# Altium project pyBehaviourLab_breakout(nucleo).PrjPcb
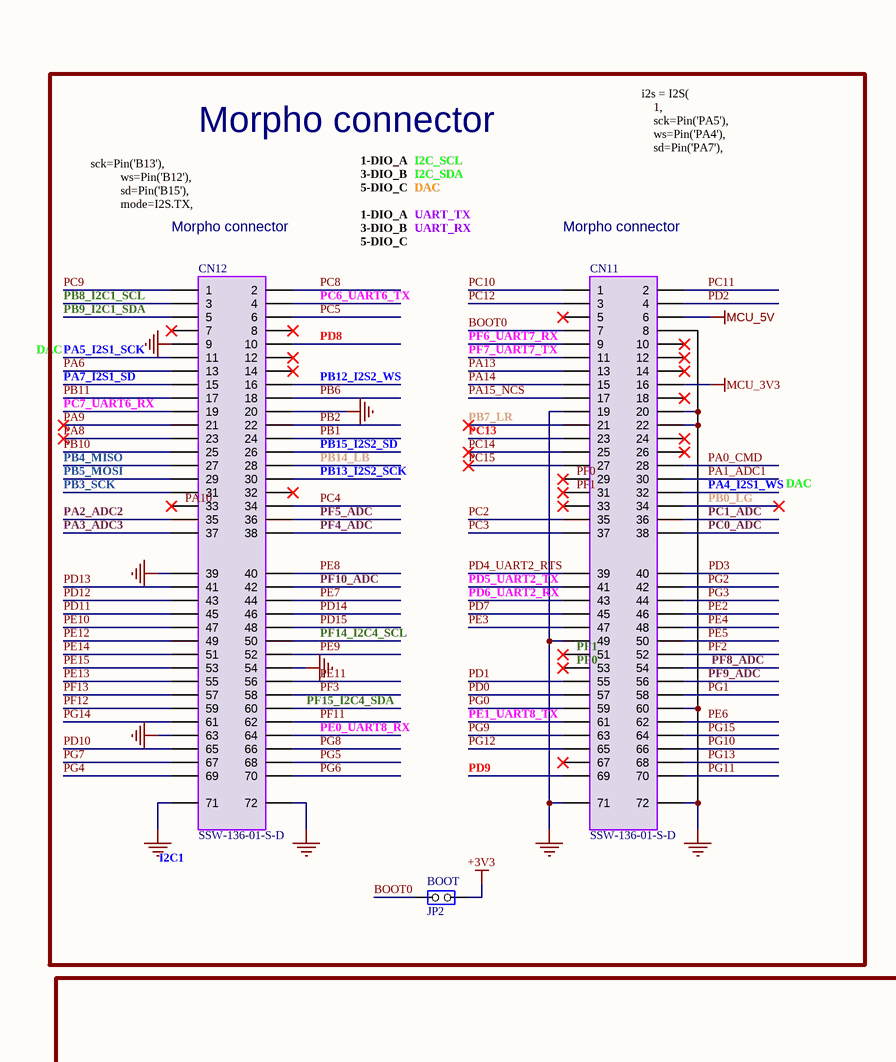
[diagram p0: pyBehaviorLab_breakout_board.SchDoc, top left]
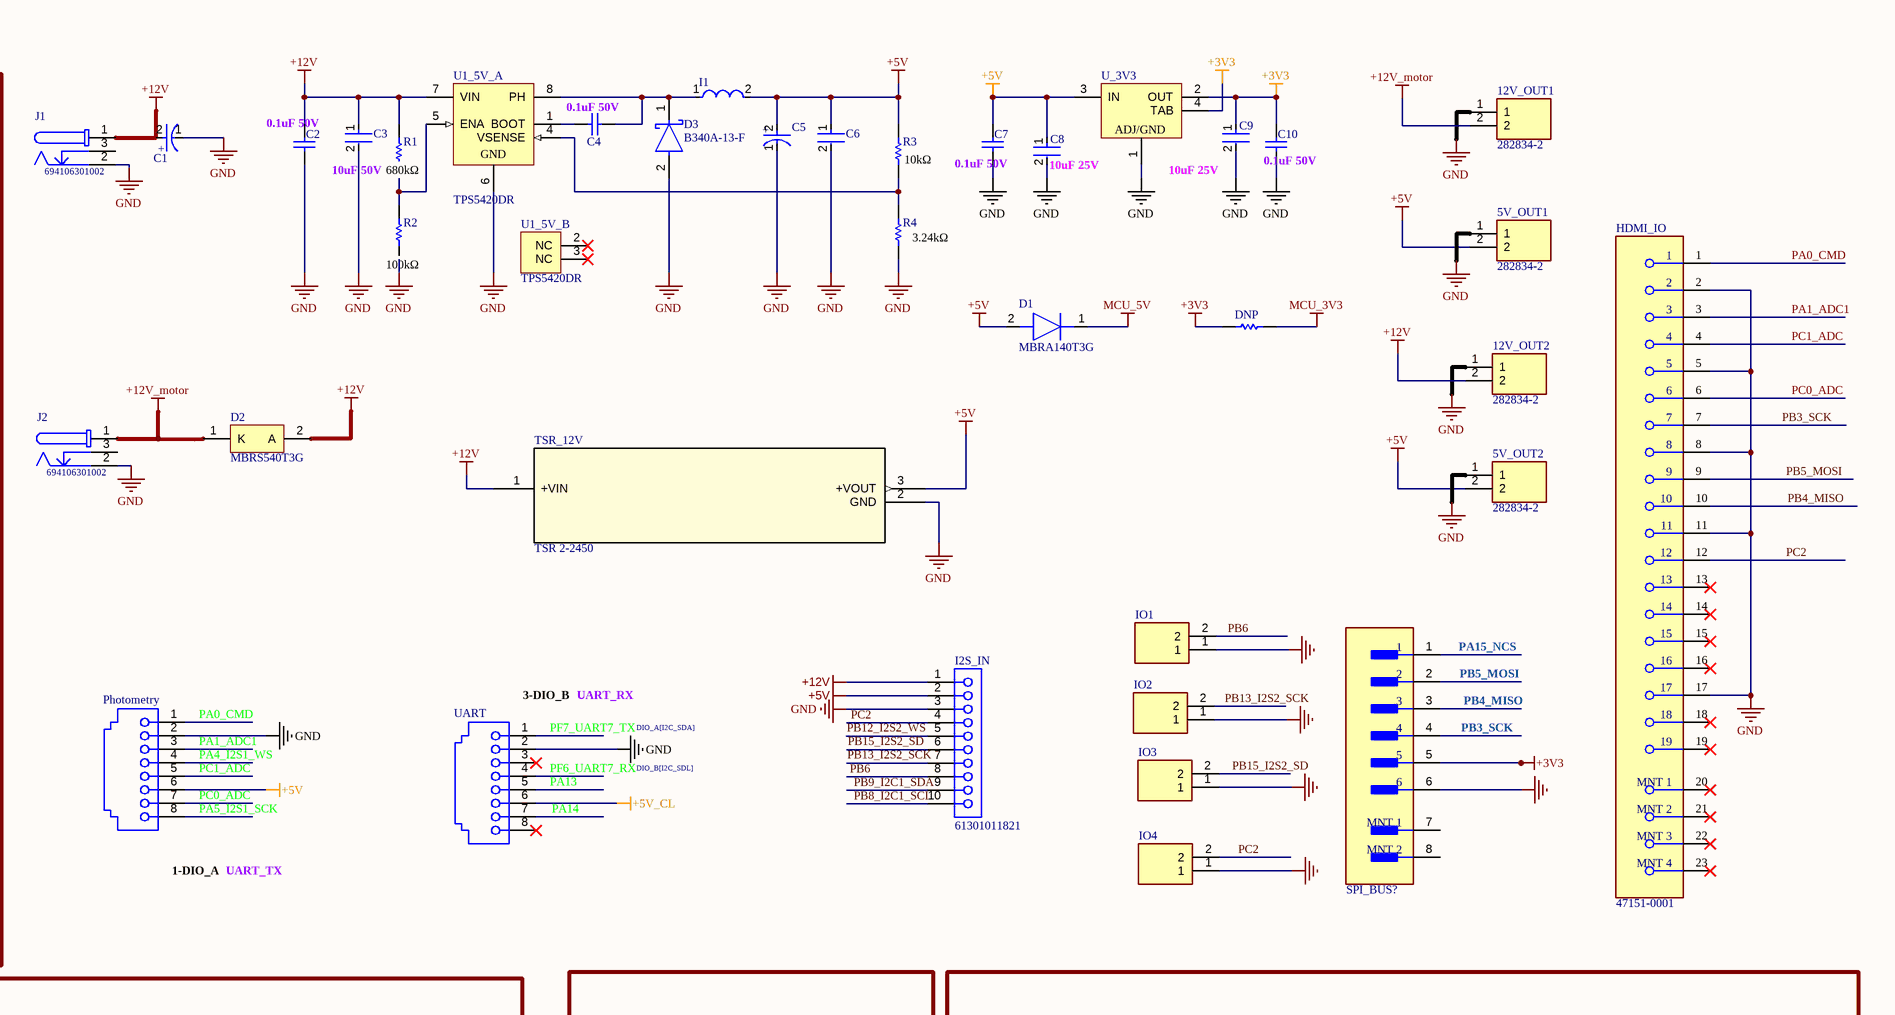
[diagram p1: pyBehaviorLab_breakout_board.SchDoc, top right]
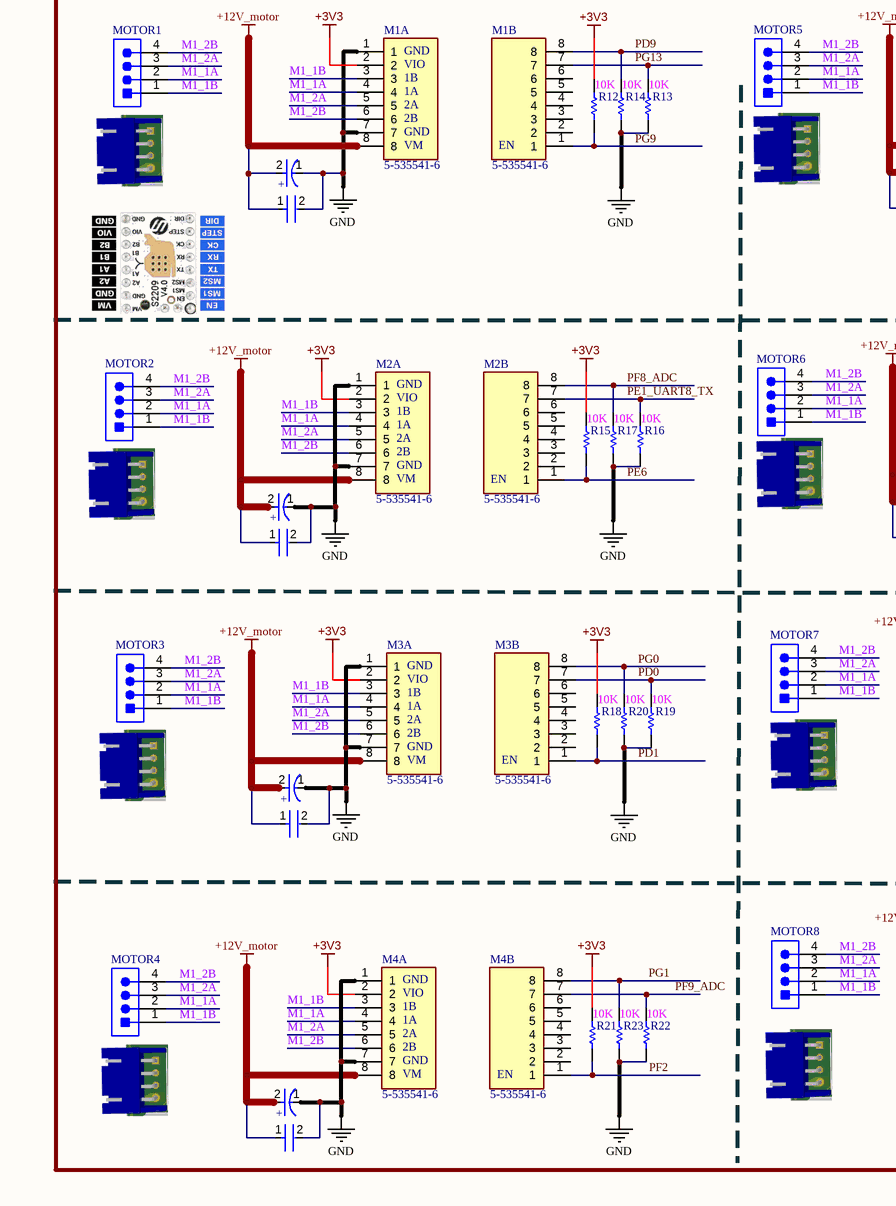
[diagram p2: pyBehaviorLab_breakout_board.SchDoc, bottom left]
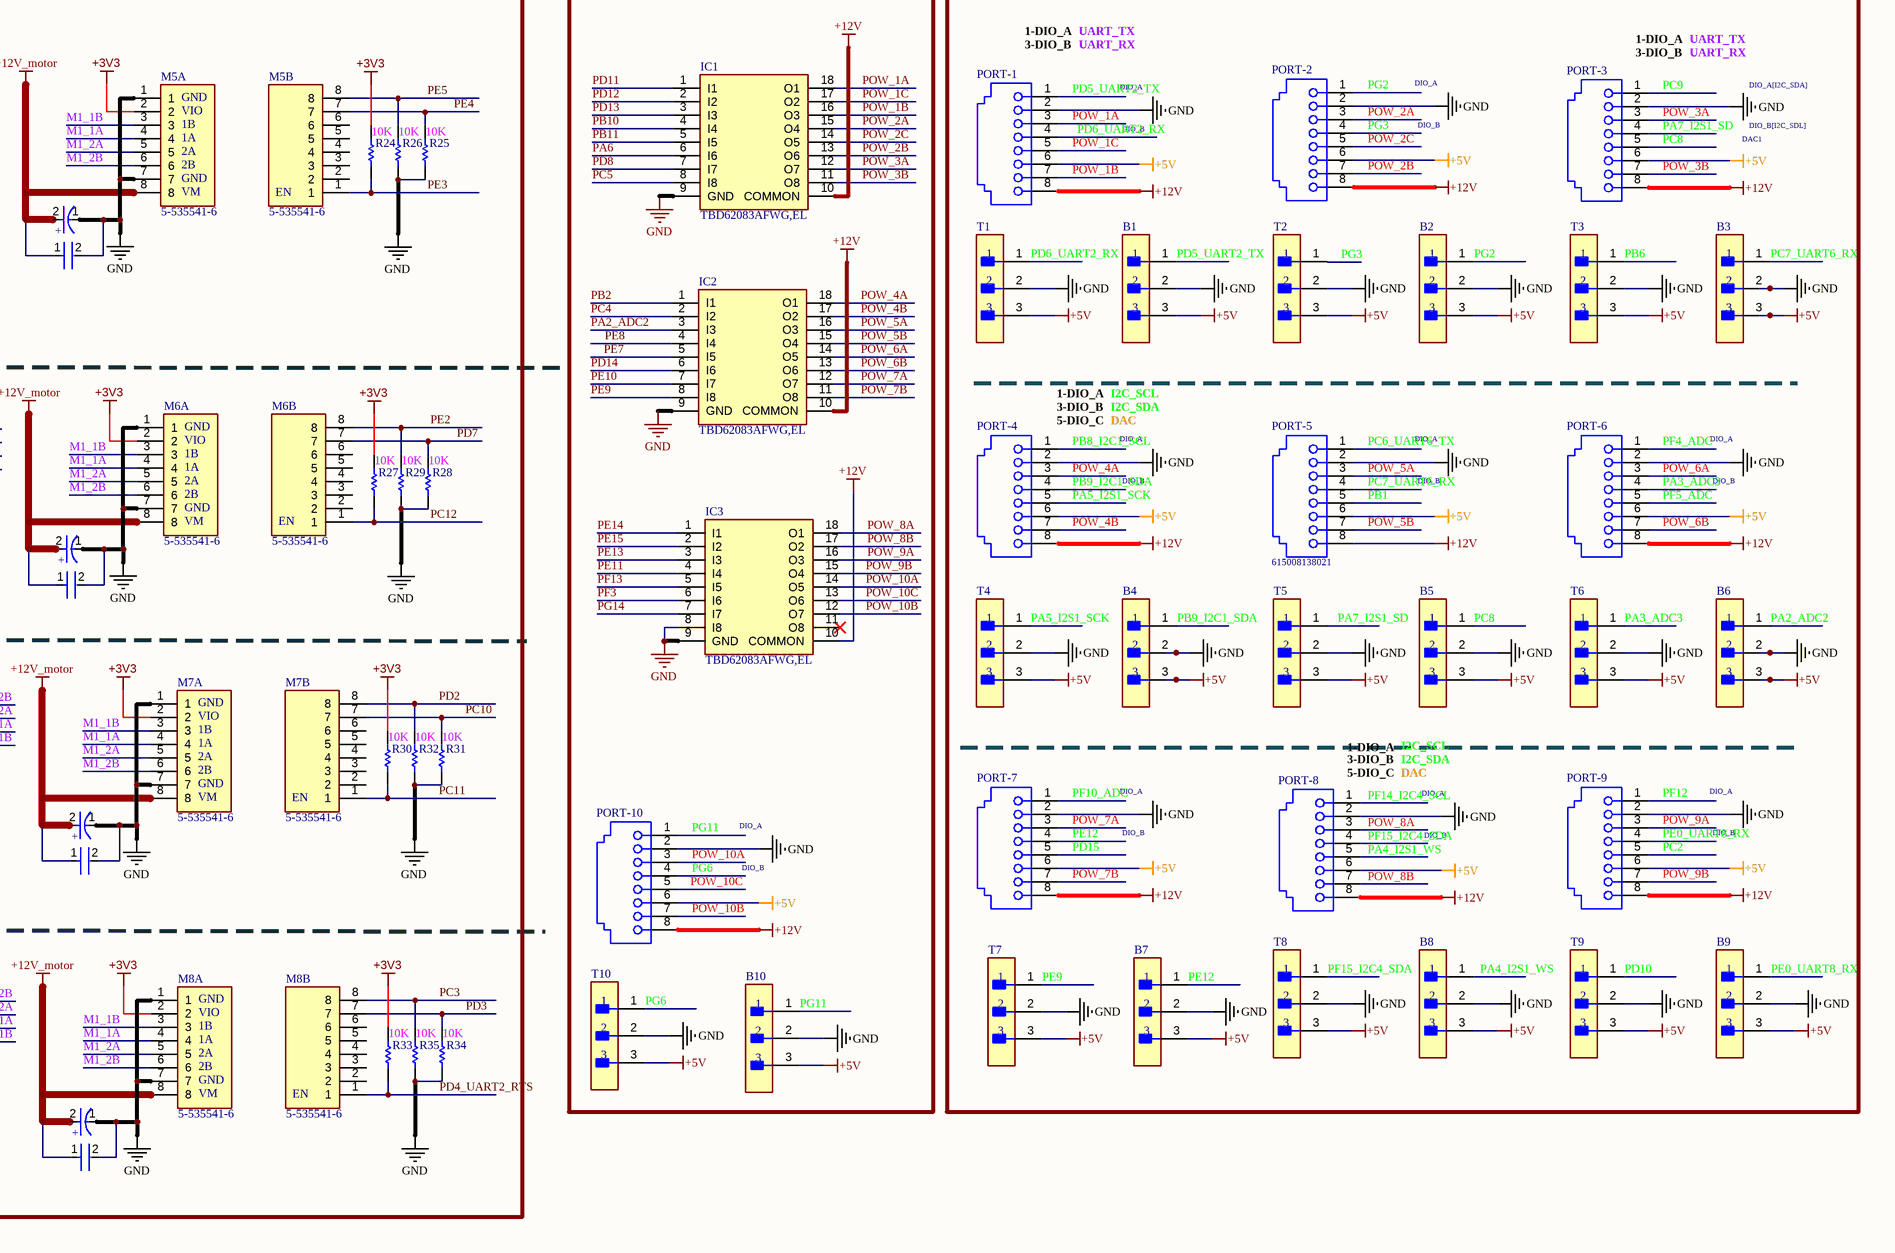
[diagram p3: pyBehaviorLab_breakout_board.SchDoc, bottom right]
CAGE_CODE: ?????; CONTRACT_NUMBER: <CONTRACT NO>; DOC_NO_ASSY_DWG: <ASSY DWG NO>; DOC_NO_BOM: <BOM DOC NO>; DOC_NO_FAB_DWG: <FAB DWG NO>; DOC_NO_SCH_DWG: <SCH DWG NO>; PCB_2_DEC_TOL: +/-.01; PCB_3_DEC_TOL: +/-.010; PCB_ANG_TOL: +/-1/2; PCB_ASSEMBLY_NO: <PCB ASSY NO>; PCB_CHECKER: - -----; PCB_CHECKER_APP_DATE: --/--/----; PCB_DESIGNER: - -----; PCB_DESIGNER_APP_DATE: --/--/----; PCB_DWG_NO: <PCB DWG NO>; PCB_ENGINEER: - -----; PCB_ENGINEER_APP_DATE: --/--/----; PCB_PART_NUMBER: <PCB PN>; PCB_REV: A; SCH_REV: A
1 sheet, 137 parts. Net scope: global (net labels, ports and power ports of the same name join across sheets).
Board file: pyBehaviorLab_breakout_board.PcbDoc

## Sheet pyBehaviorLab_breakout_board.SchDoc
size 549 x 469 mm; SheetNumber: 1; SheetTotal: 1; ENG_APP_DATE: --/--/--; DSN_APP_DATE: --/--/--; CHK_APP_DATE: --/--/--

### Parts
5V_OUT1  282834-2  [282834-2_1]
5V_OUT2  282834-2  [282834-2_1]
12V_OUT1  282834-2  [282834-2_1]
12V_OUT2  282834-2  [282834-2_1]
B1  B3B-XH-A(LF)(SN)  [FP-B3B-XH-A_LF_SN-MFG]  (value not drawn)
B2  B3B-XH-A(LF)(SN)  [FP-B3B-XH-A_LF_SN-MFG]  (value not drawn)
B3  B3B-XH-A(LF)(SN)  [FP-B3B-XH-A_LF_SN-MFG]  (value not drawn)
B4  B3B-XH-A(LF)(SN)  [FP-B3B-XH-A_LF_SN-MFG]  (value not drawn)
B5  B3B-XH-A(LF)(SN)  [FP-B3B-XH-A_LF_SN-MFG]  (value not drawn)
B6  B3B-XH-A(LF)(SN)  [FP-B3B-XH-A_LF_SN-MFG]  (value not drawn)
B7  B3B-XH-A(LF)(SN)  [FP-B3B-XH-A_LF_SN-MFG]  (value not drawn)
B8  B3B-XH-A(LF)(SN)  [FP-B3B-XH-A_LF_SN-MFG]  (value not drawn)
B9  B3B-XH-A(LF)(SN)  [FP-B3B-XH-A_LF_SN-MFG]  (value not drawn)
B10  B3B-XH-A(LF)(SN)  [FP-B3B-XH-A_LF_SN-MFG]  (value not drawn)
BOOT  JP2  [HDR_1x2_2R54_V_M_S]
C1  25SVPF47M  [FP-OS-CON-SMT-C6-MFG]  (value not drawn)
C2  GRM188R71H104KA93D  [CAPC1608X90X35ML10T15]  (value not drawn)
C3  (no value)  [FP-CGA6P-IPC_B]
C4  GRM188R71H104KA93D  [CAPC1608X90X35ML10T15]  (value not drawn)
C5  10TPC100M  [FP-POSCAP-D2-MFG]  (value not drawn)
C6  (no value)  [FP-CGA6P-IPC_B]
C7  GRM188R71H104KA93D  [CAPC1608X90X35ML10T15]  (value not drawn)
C8  CC1206KKX5R8BB105  [FP-CC1206-1_25-MFG]  (value not drawn)
C9  CC1206KKX5R8BB105  [FP-CC1206-1_25-MFG]  (value not drawn)
C10  GRM188R71H104KA93D  [CAPC1608X90X35ML10T15]  (value not drawn)
CN11  SSW-136-01-S-D  [SSW-136-XX-YYY-D]
CN12  SSW-136-01-S-D  [SSW-136-XX-YYY-D]
D1  MBRA140T3G  [DIOM5226X220N]
D2  MBRS540T3G  [ONSC-SMC-2-403-03_V]
D3  B340A-13-F  [FP-SMA-MFG]
DNP  10K  [0603R]  (value not drawn)
HDMI_IO  47151-0001  [FP-47151-0001-MFG]
I1  SRN6045TA-220M  [FP-SRN6045TA-MFG]  (value not drawn)
I2S_IN  61301011821  [61301011821]
IC1  TBD62083AFWG,EL  [SOIC127P1032X285-18N]
IC2  TBD62083AFWG,EL  [SOIC127P1032X285-18N]
IC3  TBD62083AFWG,EL  [SOIC127P1032X285-18N]
IO1  282834-2  [282834-2_1]  (value not drawn)
IO2  282834-2  [282834-2_1]  (value not drawn)
IO3  282834-2  [282834-2_1]  (value not drawn)
IO4  282834-2  [282834-2_1]  (value not drawn)
J1  694106301002  [694106301002]
J2  694106301002  [694106301002]
M1A  5-535541-6  [RHDR8W76P0X254_1X8_2032X356X673P]
M1B  5-535541-6  [RHDR8W76P0X254_1X8_2032X356X673P]
M2A  5-535541-6  [RHDR8W76P0X254_1X8_2032X356X673P]
M2B  5-535541-6  [RHDR8W76P0X254_1X8_2032X356X673P]
M3A  5-535541-6  [RHDR8W76P0X254_1X8_2032X356X673P]
M3B  5-535541-6  [RHDR8W76P0X254_1X8_2032X356X673P]
M4A  5-535541-6  [RHDR8W76P0X254_1X8_2032X356X673P]
M4B  5-535541-6  [RHDR8W76P0X254_1X8_2032X356X673P]
M5A  5-535541-6  [RHDR8W76P0X254_1X8_2032X356X673P]
M5B  5-535541-6  [RHDR8W76P0X254_1X8_2032X356X673P]
M6A  5-535541-6  [RHDR8W76P0X254_1X8_2032X356X673P]
M6B  5-535541-6  [RHDR8W76P0X254_1X8_2032X356X673P]
M7A  5-535541-6  [RHDR8W76P0X254_1X8_2032X356X673P]
M7B  5-535541-6  [RHDR8W76P0X254_1X8_2032X356X673P]
M8A  5-535541-6  [RHDR8W76P0X254_1X8_2032X356X673P]
M8B  5-535541-6  [RHDR8W76P0X254_1X8_2032X356X673P]
MCAP1_A  25SVPF47M  [FP-OS-CON-SMT-C6-MFG]  (value not drawn)
MCAP1_B  (no value)  [FP-CGA6P-IPC_B]
MCAP2_A  25SVPF47M  [FP-OS-CON-SMT-C6-MFG]  (value not drawn)
MCAP2_B  (no value)  [FP-CGA6P-IPC_B]
MCAP3_A  25SVPF47M  [FP-OS-CON-SMT-C6-MFG]  (value not drawn)
MCAP3_B  (no value)  [FP-CGA6P-IPC_B]
MCAP4_A  25SVPF47M  [FP-OS-CON-SMT-C6-MFG]  (value not drawn)
MCAP4_B  (no value)  [FP-CGA6P-IPC_B]
MCAP5_A  25SVPF47M  [FP-OS-CON-SMT-C6-MFG]  (value not drawn)
MCAP5_B  (no value)  [FP-CGA6P-IPC_B]
MCAP6_A  25SVPF47M  [FP-OS-CON-SMT-C6-MFG]  (value not drawn)
MCAP6_B  (no value)  [FP-CGA6P-IPC_B]
MCAP7_A  25SVPF47M  [FP-OS-CON-SMT-C6-MFG]  (value not drawn)
MCAP7_B  (no value)  [FP-CGA6P-IPC_B]
MCAP8_A  25SVPF47M  [FP-OS-CON-SMT-C6-MFG]  (value not drawn)
MCAP8_B  (no value)  [FP-CGA6P-IPC_B]
MOTOR1  S4B-XH-A(LF)(SN)  [JST-S4B-XH-A(LF)(SN)_V]  (value not drawn)
MOTOR2  S4B-XH-A(LF)(SN)  [JST-S4B-XH-A(LF)(SN)_V]  (value not drawn)
MOTOR3  S4B-XH-A(LF)(SN)  [JST-S4B-XH-A(LF)(SN)_V]  (value not drawn)
MOTOR4  S4B-XH-A(LF)(SN)  [JST-S4B-XH-A(LF)(SN)_V]  (value not drawn)
MOTOR5  S4B-XH-A(LF)(SN)  [JST-S4B-XH-A(LF)(SN)_V]  (value not drawn)
MOTOR6  S4B-XH-A(LF)(SN)  [JST-S4B-XH-A(LF)(SN)_V]  (value not drawn)
MOTOR7  S4B-XH-A(LF)(SN)  [JST-S4B-XH-A(LF)(SN)_V]  (value not drawn)
MOTOR8  S4B-XH-A(LF)(SN)  [JST-S4B-XH-A(LF)(SN)_V]  (value not drawn)
Photometry  615008138021  [615008138021]  (value not drawn)
PORT-1  615008138021  [615008138021]  (value not drawn)
PORT-2  615008138021  [615008138021]  (value not drawn)
PORT-3  615008138021  [615008138021]  (value not drawn)
PORT-4  615008138021  [615008138021]  (value not drawn)
PORT-5  615008138021  [615008138021]
PORT-6  615008138021  [615008138021]  (value not drawn)
PORT-7  615008138021  [615008138021]  (value not drawn)
PORT-8  615008138021  [615008138021]  (value not drawn)
PORT-9  615008138021  [615008138021]  (value not drawn)
PORT-10  615008138021  [615008138021]  (value not drawn)
R1  680K  [0603R]  (value not drawn)
R2  100K  [0603R]  (value not drawn)
R3  10K  [0603R]  (value not drawn)
R4  3K2  [0603R]  (value not drawn)
R12  10K  [0603R]  (value not drawn)
R13  10K  [0603R]  (value not drawn)
R14  10K  [0603R]  (value not drawn)
R15  10K  [0603R]  (value not drawn)
R16  10K  [0603R]  (value not drawn)
R17  10K  [0603R]  (value not drawn)
R18  10K  [0603R]  (value not drawn)
R19  10K  [0603R]  (value not drawn)
R20  10K  [0603R]  (value not drawn)
R21  10K  [0603R]  (value not drawn)
R22  10K  [0603R]  (value not drawn)
R23  10K  [0603R]  (value not drawn)
R24  10K  [0603R]  (value not drawn)
R25  10K  [0603R]  (value not drawn)
R26  10K  [0603R]  (value not drawn)
R27  10K  [0603R]  (value not drawn)
R28  10K  [0603R]  (value not drawn)
R29  10K  [0603R]  (value not drawn)
R30  10K  [0603R]  (value not drawn)
R31  10K  [0603R]  (value not drawn)
R32  10K  [0603R]  (value not drawn)
R33  10K  [0603R]  (value not drawn)
R34  10K  [0603R]  (value not drawn)
R35  10K  [0603R]  (value not drawn)
SPI_BUS?  B6B-PH-SM4-TB(LF)(SN)  [FP-B6B-PH-SM4-TB_LF_SN-MFG]  (value not drawn)
T1  B3B-XH-A(LF)(SN)  [FP-B3B-XH-A_LF_SN-MFG]  (value not drawn)
T2  B3B-XH-A(LF)(SN)  [FP-B3B-XH-A_LF_SN-MFG]  (value not drawn)
T3  B3B-XH-A(LF)(SN)  [FP-B3B-XH-A_LF_SN-MFG]  (value not drawn)
T4  B3B-XH-A(LF)(SN)  [FP-B3B-XH-A_LF_SN-MFG]  (value not drawn)
T5  B3B-XH-A(LF)(SN)  [FP-B3B-XH-A_LF_SN-MFG]  (value not drawn)
T6  B3B-XH-A(LF)(SN)  [FP-B3B-XH-A_LF_SN-MFG]  (value not drawn)
T7  B3B-XH-A(LF)(SN)  [FP-B3B-XH-A_LF_SN-MFG]  (value not drawn)
T8  B3B-XH-A(LF)(SN)  [FP-B3B-XH-A_LF_SN-MFG]  (value not drawn)
T9  B3B-XH-A(LF)(SN)  [FP-B3B-XH-A_LF_SN-MFG]  (value not drawn)
T10  B3B-XH-A(LF)(SN)  [FP-B3B-XH-A_LF_SN-MFG]  (value not drawn)
TSR_12V  TSR 2-2450  [TSR 2-2450_TRP]
U1_5V_  TPS5420DR  [D0008A_N]  (parts A,B of 2)
U_3V3  NCP1117ST33T3G  [ONSC-SOT-223-4-318H-01_A_V]  (value not drawn)
UART  615008138021  [615008138021]  (value not drawn)

### Blocks framed on the sheet
Morpho connector: BOOT CN11 CN12

### Nets
+3V3: BOOT.2(NO) C9.1 C10.2 DNP.1 M1A.2 M2A.2 M3A.2 M4A.2 M5A.2 M6A.2 M7A.2 M8A.2 R12.1 R15.1 R18.1 R21.1 R24.1 R27.1 R30.1 R33.1 SPI_BUS?.5 U_3V3.2(OUT) U_3V3.4(TAB)
+5V: 5V_OUT1.2 5V_OUT2.2 B1.3 B2.3 B3.3 B4.3 B5.3 B6.3 B7.3 B8.3 B9.3 B10.3 C5.2(A) C6.1 C7.2 C8.1 D1.2(A) I1.2 I2S_IN.2 Photometry.6 PORT-1.6 PORT-2.6 PORT-3.6 PORT-4.6 PORT-5.6 PORT-6.6 PORT-7.6 PORT-8.6 PORT-9.6 PORT-10.6 R3.1 T1.3 T2.3 T3.3 T4.3 T5.3 T6.3 T7.3 T8.3 T9.3 T10.3 TSR_12V.3(+VOUT) U_3V3.3(IN)
+5V_CL: UART.6
+12V: 12V_OUT2.2 C1.2(A) C2.2 C3.1 D2.2(A) I2S_IN.1 IC1.10(COMMON) IC2.10(COMMON) IC3.10(COMMON) J1.1 PORT-1.8 PORT-2.8 PORT-3.8 PORT-4.8 PORT-5.8 PORT-6.8 PORT-7.8 PORT-8.8 PORT-9.8 PORT-10.8 R1.1 TSR_12V.1(+VIN) U1_5V_.7(VIN)
+12V_motor: 12V_OUT1.2 D2.1(K) J2.1 M1A.8 M2A.8 M3A.8 M4A.8 M5A.8 M6A.8 M7A.8 M8A.8 MCAP1_A.2(A) MCAP1_B.1 MCAP2_A.2(A) MCAP2_B.1 MCAP3_A.2(A) MCAP3_B.1 MCAP4_A.2(A) MCAP4_B.1 MCAP5_A.2(A) MCAP5_B.1 MCAP6_A.2(A) MCAP6_B.1 MCAP7_A.2(A) MCAP7_B.1 MCAP8_A.2(A) MCAP8_B.1
GND: 5V_OUT1.1 5V_OUT2.1 12V_OUT1.1 12V_OUT2.1 B1.2 B2.2 B3.2 B4.2 B5.2 B6.2 B7.2 B8.2 B9.2 B10.2 C1.1(C) C2.1 C3.2 C5.1(C) C6.2 C7.1 C8.2 C9.2 C10.1 CN11.8 CN11.19 CN11.20 CN11.22 CN11.49 CN11.60 CN11.71 CN11.72 CN12.9 CN12.20 CN12.39 CN12.54 CN12.63 CN12.71 CN12.72 D3.2(A) HDMI_IO.2 HDMI_IO.5 HDMI_IO.8 HDMI_IO.11 HDMI_IO.17 I2S_IN.3 IC1.9(GND) IC2.9(GND) IC3.8(I8) IC3.9(GND) IO1.1 IO2.1 IO3.1 IO4.1 J1.2 J2.2 M1A.1 M1A.7 M2A.1 M2A.7 M3A.1 M3A.7 M4A.1 M4A.7 M5A.1 M5A.7 M6A.1 M6A.7 M7A.1 M7A.7 M8A.1 M8A.7 MCAP1_A.1(C) MCAP1_B.2 MCAP2_A.1(C) MCAP2_B.2 MCAP3_A.1(C) MCAP3_B.2 MCAP4_A.1(C) MCAP4_B.2 MCAP5_A.1(C) MCAP5_B.2 MCAP6_A.1(C) MCAP6_B.2 MCAP7_A.1(C) MCAP7_B.2 MCAP8_A.1(C) MCAP8_B.2 Photometry.2 PORT-1.2 PORT-2.2 PORT-3.2 PORT-4.2 PORT-5.2 PORT-6.2 PORT-7.2 PORT-8.2 PORT-9.2 PORT-10.2 R2.2 R4.2 R13.2 R14.2 R16.2 R17.2 R19.2 R20.2 R22.2 R23.2 R25.2 R26.2 R28.2 R29.2 R31.2 R32.2 R34.2 R35.2 SPI_BUS?.6 T1.2 T2.2 T3.2 T4.2 T5.2 T6.2 T7.2 T8.2 T9.2 T10.2 TSR_12V.2(GND) U1_5V_.6(GND) U_3V3.1(ADJ/GND) UART.2
MCU_3V3: CN11.16 DNP.2
MCU_5V: CN11.6 D1.1(K)
\: B8.1 CN11.32 Photometry.4 PORT-8.5  [also labelled PA4_I2S1_WS]
BOOT0: BOOT.1(COMMON) CN11.7
M1_1A: M1A.4 M2A.4 M3A.4 M4A.4 M5A.4 M6A.4 M7A.4 M8A.4 MOTOR1.2 MOTOR2.2 MOTOR3.2 MOTOR4.2 MOTOR5.2 MOTOR6.2 MOTOR7.2 MOTOR8.2
M1_1B: M1A.3 M2A.3 M3A.3 M4A.3 M5A.3 M6A.3 M7A.3 M8A.3 MOTOR1.1 MOTOR2.1 MOTOR3.1 MOTOR4.1 MOTOR5.1 MOTOR6.1 MOTOR7.1 MOTOR8.1
M1_2A: M1A.5 M2A.5 M3A.5 M4A.5 M5A.5 M6A.5 M7A.5 M8A.5 MOTOR1.3 MOTOR2.3 MOTOR3.3 MOTOR4.3 MOTOR5.3 MOTOR6.3 MOTOR7.3 MOTOR8.3
M1_2B: M1A.6 M2A.6 M3A.6 M4A.6 M5A.6 M6A.6 M7A.6 M8A.6 MOTOR1.4 MOTOR2.4 MOTOR3.4 MOTOR4.4 MOTOR5.4 MOTOR6.4 MOTOR7.4 MOTOR8.4
PA0_CMD: CN11.28 HDMI_IO.1 Photometry.1
PA1_ADC1: CN11.30 HDMI_IO.3 Photometry.3
PA2_ADC2: B6.1 CN12.35 IC2.3(I3)
PA3_ADC3: CN12.37 PORT-6.4 T6.1
PA5_I2S1_SCK: CN12.11 Photometry.8 PORT-4.5 T4.1
PA6: CN12.13 IC1.6(I6)
PA7_I2S1_SD: CN12.15 PORT-3.4 T5.1
PA8: CN12.23
PA9: CN12.21
PA13: CN11.13 UART.5
PA14: CN11.15 UART.7
PA15_NCS: CN11.17 SPI_BUS?.1
PB0_LG: CN11.34
PB1: CN12.24 PORT-5.5
PB2: CN12.22 IC2.1(I1)
PB3_SCK: CN12.31 HDMI_IO.7 SPI_BUS?.4
PB4_MISO: CN12.27 HDMI_IO.10 SPI_BUS?.3
PB5_MOSI: CN12.29 HDMI_IO.9 SPI_BUS?.2
PB6: CN12.18 I2S_IN.8 IO1.2 T3.1
PB7_LR: CN11.21
PB8_I2C1_SCL: CN12.3 I2S_IN.10 PORT-4.1
PB9_I2C1_SDA: B4.1 CN12.5 I2S_IN.9 PORT-4.4
PB10: CN12.25 IC1.4(I4)
PB11: CN12.17 IC1.5(I5)
PB12_I2S2_WS: CN12.16 I2S_IN.5
PB13_I2S2_SCK: CN12.30 I2S_IN.7 IO2.2
PB14_LB: CN12.28
PB15_I2S2_SD: CN12.26 I2S_IN.6 IO3.2
PC0_ADC: CN11.38 HDMI_IO.6 Photometry.7
PC1_ADC: CN11.36 HDMI_IO.4 Photometry.5
PC2: CN11.35 HDMI_IO.12 I2S_IN.4 IO4.2 PORT-9.5
PC3: CN11.37 M8B.8 R35.1
PC4: CN12.34 IC2.2(I2)
PC5: CN12.6 IC1.8(I8)
PC6_UART6_TX: CN12.4 PORT-5.1
PC7_UART6_RX: B3.1 CN12.19 PORT-5.4
PC8: B5.1 CN12.2 PORT-3.5
PC9: CN12.1 PORT-3.1
PC10: CN11.1 M7B.7 R31.1
PC11: CN11.2 M7B.1 R30.2
PC12: CN11.3 M6B.1 R27.2
PC13: CN11.23
PC14: CN11.25
PC15: CN11.27
PD0: CN11.57 M3B.7 R19.1
PD1: CN11.55 M3B.1 R18.2
PD2: CN11.4 M7B.8 R32.1
PD3: CN11.40 M8B.7 R34.1
PD4_UART2_RTS: CN11.39 M8B.1 R33.2
PD5_UART2_TX: B1.1 CN11.41 PORT-1.1
PD6_UART2_RX: CN11.43 PORT-1.4 T1.1
PD7: CN11.45 M6B.7 R28.1
PD8: CN12.10 IC1.7(I7)
PD9: CN11.69 M1B.8 R14.1
PD10: CN12.65 T9.1
PD11: CN12.45 IC1.1(I1)
PD12: CN12.43 IC1.2(I2)
PD13: CN12.41 IC1.3(I3)
PD14: CN12.46 IC2.6(I6)
PD15: CN12.48 PORT-7.5
PE0_UART8_RX: B9.1 CN12.64 PORT-9.4
PE1_UART8_TX: CN11.61 M2B.7 R16.1
PE2: CN11.46 M6B.8 R29.1
PE3: CN11.47 M5B.1 R24.2
PE4: CN11.48 M5B.7 R25.1
PE5: CN11.50 M5B.8 R26.1
PE6: CN11.62 M2B.1 R15.2
PE7: CN12.44 IC2.5(I5)
PE8: CN12.40 IC2.4(I4)
PE9: CN12.52 IC2.8(I8) T7.1
PE10: CN12.47 IC2.7(I7)
PE11: CN12.56 IC3.4(I4)
PE12: B7.1 CN12.49 PORT-7.4
PE13: CN12.55 IC3.3(I3)
PE14: CN12.51 IC3.1(I1)
PE15: CN12.53 IC3.2(I2)
PF2: CN11.52 M4B.1 R21.2
PF3: CN12.58 IC3.6(I6)
PF4_ADC: CN12.38 PORT-6.1
PF5_ADC: CN12.36 PORT-6.5
PF6_UART7_RX: CN11.9 UART.4
PF7_UART7_TX: CN11.11 UART.1
PF8_ADC: CN11.54 M2B.8 R17.1
PF9_ADC: CN11.56 M4B.7 R22.1
PF10_ADC: CN12.42 PORT-7.1
PF11: CN12.62
PF12: CN12.59 PORT-9.1
PF13: CN12.57 IC3.5(I5)
PF14_I2C4_SCL: CN12.50 PORT-8.1
PF15_I2C4_SDA: CN12.60 PORT-8.4 T8.1
PG0: CN11.59 M3B.8 R20.1
PG1: CN11.58 M4B.8 R23.1
PG2: B2.1 CN11.42 PORT-2.1
PG3: CN11.44 PORT-2.4 T2.1
PG4: CN12.69
PG5: CN12.68
PG6: CN12.70 PORT-10.4 T10.1
PG7: CN12.67
PG8: CN12.66
PG9: CN11.63 M1B.1 R12.2
PG10: CN11.66
PG11: B10.1 CN11.70 PORT-10.1
PG12: CN11.65
PG13: CN11.68 M1B.7 R13.1
PG14: CN12.61 IC3.7(I7)
PG15: CN11.64
POW_1A: IC1.18(O1) PORT-1.3
POW_1B: IC1.16(O3) PORT-1.7
POW_1C: IC1.17(O2) PORT-1.5
POW_2A: IC1.15(O4) PORT-2.3
POW_2B: IC1.13(O6) PORT-2.7
POW_2C: IC1.14(O5) PORT-2.5
POW_3A: IC1.12(O7) PORT-3.3
POW_3B: IC1.11(O8) PORT-3.7
POW_4A: IC2.18(O1) PORT-4.3
POW_4B: IC2.17(O2) PORT-4.7
POW_5A: IC2.16(O3) PORT-5.3
POW_5B: IC2.15(O4) PORT-5.7
POW_6A: IC2.14(O5) PORT-6.3
POW_6B: IC2.13(O6) PORT-6.7
POW_7A: IC2.12(O7) PORT-7.3
POW_7B: IC2.11(O8) PORT-7.7
POW_8A: IC3.18(O1) PORT-8.3
POW_8B: IC3.17(O2) PORT-8.7
POW_9A: IC3.16(O3) PORT-9.3
POW_9B: IC3.15(O4) PORT-9.7
POW_10A: IC3.14(O5) PORT-10.3
POW_10B: IC3.12(O7) PORT-10.7
POW_10C: IC3.13(O6) PORT-10.5
NetC4_1: C4.1 D3.1(C) I1.1 U1_5V_.8(PH)
NetC4_2: C4.2 U1_5V_.1(BOOT)
NetR1_2: R1.2 R2.1 U1_5V_.5(ENA)
NetR3_2: R3.2 R4.1 U1_5V_.4(VSENSE)

Not connected (* = marked no-connect by the designer): CN11 5* 10* 12* 14* 18* 24* 26* 29* 31* 33* 51* 53* 67*; CN12 7* 8* 12* 14* 32* 33*; HDMI_IO 13* 14* 15* 16* 18* 19* 20(MNT_1)* 21(MNT_2)* 22(MNT_3)* 23(MNT_4)*; IC3 11(O8)*; J1 3; J2 3; M1B 2 3 4 5 6; M2B 2 3 4 5 6; M3B 2 3 4 5 6; M4B 2 3 4 5 6; M5B 2 3 4 5 6; M6B 2 3 4 5 6; M7B 2 3 4 5 6; M8B 2 3 4 5 6; SPI_BUS? 7(MNT_1) 8(MNT_2); U1_5V_ 2(NC)* 3(NC)*; UART 3* 8*

### Notes on the sheet
- i2s = I2S(
  1,
  sck=Pin('PA5'),
  ws=Pin('PA4'),
  sd=Pin('PA7'),
- (near C2) 0.1uF 50V
- (near C4) 0.1uF 50V
- (near R3) 10kΩ
- 1-DIO_A
- 3-DIO_B
- 5-DIO_C
- I2C_SCL
- I2C_SDA
- DAC
- UART_TX
- (near R1) 10uF 50V
- (near R1) 680kΩ
- (near C7) 0.1uF 50V
- (near C8) 10uF 25V
- 10uF 25V
- (near C10) 0.1uF 50V
- sck=Pin('B13'),
  ws=Pin('B12'),
  sd=Pin('B15'),
  mode=I2S.TX,
- Morpho connector
- UART_RX
- (near R2) 100kΩ
- (near R4) 3.24kΩ
- (near UART) 3-DIO_B
- DIO_A[I2C_SDA]
- DIO_B[I2C_SDL]
- (near CN12) I2C1
- (near Photometry) 1-DIO_A
- (near M1A) GND
- (near M1B) DIR
- (near M5A) GND
- (near M5B) DIR
- (near PORT-1) 3-DIO_B
- DIO_A
- (near PORT-3) 1-DIO_A
- (near PORT-3) 3-DIO_B
- (near M1A) VIO
- (near M1A) 1B
- (near M1A) 1A
- (near M1A) 2A
- (near M1A) 2B
- (near M1B) STEP
- (near M1B) PDN
- (near M1B) UART
- (near M1B) SPRD
- (near M1B) MS1
- (near R12) 10K
- (near R14) 10K
- (near R13) 10K
- (near M5A) VIO
- (near M5A) 1B
- (near M5A) 1A
- (near M5A) 2A
- (near M5A) 2B
- (near M5B) STEP
- (near M5B) PDN
- (near M5B) UART
- (near M5B) SPRD
- (near M5B) MS1
- (near R24) 10K
- (near R26) 10K
- (near R25) 10K
- DIO_B
- DAC1
- (near M1A) VM
- (near M1B) EN
- (near M1B) MS2
- (near M5A) VM
- (near M5B) EN
- (near M5B) MS2
- (near M2A) GND
- (near M2B) DIR
- (near M6A) GND
- (near M6B) DIR
- (near M6B) STEP
- (near PORT-4) 1-DIO_A
- (near PORT-4) 3-DIO_B
- (near PORT-4) 5-DIO_C
- (near M2A) VIO
- (near M2A) 1B
- (near M2A) 1A
- (near M2A) 2A
- (near M2A) 2B
- (near M2B) STEP
- (near M2B) PDN
- (near M2B) UART
- (near M2B) SPRD
- (near M2B) MS1
- (near R15) 10K
- (near R17) 10K
- (near R16) 10K
- (near M6A) VIO
- (near M6A) 1B
- (near M6A) 1A
- (near M6A) 2A
- (near M6A) 2B
- (near M6B) PDN
- (near M6B) UART
- (near M6B) SPRD
- (near M6B) MS1
- (near M6B) MS2
- (near R27) 10K
- (near R29) 10K
- (near R28) 10K
- (near M2A) VM
- (near M2B) EN
- (near M2B) MS2
- (near M6A) VM
- (near M6B) EN
- (near M7A) GND
- (near M7B) DIR
- (near M3A) GND
- (near M3A) VIO
- (near M3A) 1B
- (near M3A) 1A
- (near M3A) 2A
- (near M3B) DIR
- (near M3B) STEP
- (near M3B) PDN
- (near M3B) UART
- (near M3B) SPRD
- (near R18) 10K
- (near R20) 10K
- (near R19) 10K
- (near M7A) VIO
- (near M7A) 1B
- (near M7A) 1A
- (near M7A) 2A
- (near M7A) 2B
- (near M7B) STEP
- (near M7B) PDN
- (near M7B) UART
- (near M7B) SPRD
- (near M7B) MS1
- (near R30) 10K
- (near R32) 10K
- (near R31) 10K
- (near PORT-8) 3-DIO_B
- (near PORT-8) 5-DIO_C
- (near M3A) 2B
- (near M3A) VM
- (near M3B) EN
- (near M3B) MS1
- (near M3B) MS2
- (near M7A) VM
- (near M7B) EN
- (near M7B) MS2
- (near M4A) GND
- (near M4A) VIO
- (near M4B) DIR
- (near M4B) STEP
- (near M8A) GND
- (near M8A) VIO
- (near M8A) 1B
- (near M8A) 1A
- (near M8B) DIR
- (near M8B) STEP
- (near M8B) PDN
- (near M8B) UART
- (near R33) 10K
- (near R35) 10K
- (near R34) 10K
- (near M4A) 1B
- (near M4A) 1A
- (near M4A) 2A
- (near M4A) 2B
- (near M4B) PDN
- (near M4B) UART
- (near M4B) SPRD
- (near M4B) MS1
- (near M4B) MS2
- (near R21) 10K
- (near R23) 10K
- (near R22) 10K
- (near M8A) 2A
- (near M8A) 2B
- (near M8A) VM
- (near M8B) EN
- (near M8B) SPRD
- (near M8B) MS1
- (near M8B) MS2
- (near M4A) VM
- (near M4B) EN
- Labels drawn without touching a wire or pin: PA10, PF0, PF1
- DWG. NO.
- REV.
- SHT.
- THIS DOCUMENT AND THE DATA DISCLOSED HEREIN OR HEREWITH IS THE PROPERTY OF ALTIUM LIMITED AND MAY BE FREELY DISTRIBUTED IN WHOLE. NO RIGHTS ARE RESERVED OR EXPRESS OR IMPLIED WARANTEE GIVEN.
- REVISION
- DESCRIPTION
- DATE
- APPROVED
- ENG:
- APPROVALS
- PROJECT
- DSN:
- CHK:
- REFERENCE DOCUMENTS
- PROJECT REVISION:
- TITLE
- DOCUMENT REVISION:
- DESIGN ITEM:
- BOM:
- FAB DWG:
- PCB DWG:
- ASSY DWG:
- SCALE:
- SIZE
- B
- CAGE CODE
- FILE NAME
- DWG NO.
- SHEET
- OF
- REV
- (in symbol CMP-05427-000065-2) +
- (in symbol CMP-05428-000328-1) +

### Library data of the parts
5V_OUT1 5V_OUT2 12V_OUT1 12V_OUT2 = 282834-2: Connector (C592983); Manufacturer_Name: TE Connectivity; Datasheet Link: https://componentsearchengine.com//282834-2.pdf; Mouser2 Part Number: 571-282834-2; Mouser2 Price/Stock: https://www.mouser.com/Search/Refine.aspx?Keyword=571-282834-2; Manufacturer_Part_Number: 282834-2
B1-B10 = CMP-17439-000014-3: -25℃~+85℃ 1 1x3P 2.5mm 3 3A 3P Brass Through Hole Tin XH Plugin,P=2.5mm Wire To Board Connector ROHS (C2908601); Max Voltage Rating (DC): 250V; Number of Positions: 3; Connector Type: Header; Gender: Male; Wire/Cable Gauge: 22AWG; Contact Resistance: 20mR; Insulation Resistance: 1GR; Insulation Material: Nylon; Contact Plating: Tin; Depth: 5.75mm; Contact Type: Male Pin; Max Operating Temperature: 85°C; Current Rating: 3A; Insulation Color: Natural; Voltage Rating (AC): 250V; Color: Natural; Orientation: Straight; Fastening Type: Detent; Housing Color: White; Min Operating Temperature: -25°C; Termination: Solder; Voltage Rating: 250V; Series: XH; Pitch: 2.5mm; Contact Shape: Square; Number of Rows: 1; Lead Free: Lead Free; Packaging: Bulk; Mount: Through Hole; Flammability Rating: UL94 V-0; Max Voltage Rating (AC): 250V; REACH SVHC: No SVHC; Housing Material: Polyamide; Contact Material: Brass; Lead Pitch: 2.5mm; Contact Finish - Mating: TIN; Length: 9.9mm; Max Current Rating: 3A; Number of Contacts: 3
C1 MCAP1_A MCAP2_A MCAP3_A MCAP4_A MCAP5_A MCAP6_A MCAP7_A MCAP8_A = CMP-05427-000065-2: Conductive Polymer Aluminum Solid Capacitors (OS-CON) 47uF ±20% 25V (C136280); Ripple Current: 2.8A; Polarity: Polar; Leakage Current: 235uA; Dissipation Factor: 12%; ESR (Equivalent Series Resistance): 30mR; Life (Hours): 5000Hour; Diameter: 6.3mm; Voltage: 25V; Package Quantity: 1000; Packaging: Tape and Reel; Height - Seated (Max): 0.236inch; Case/Package: Radial; Termination: SMD/SMT; Series: OS-CON™, SVPF; Number of Pins: 6; Capacitance: 47uF; Min Operating Temperature: -55°C; Mount: Surface Mount; RoHS Compliant: Yes; Voltage Rating (DC): 25V; Length: 5.9mm; REACH SVHC: No SVHC; Voltage Rating: 25V; Ripple Current (AC): 2.8A; Tolerance: 20%; Height: 5.9mm; Max Operating Temperature: 105°C
C2 C4 C7 C10 = CMP-2100-03643-1: Chip Capacitor, 0.1 uF, +/- 10%, 50 V, -55 to 125 degC, 0603 (1608 Metric), RoHS, Tape and Reel (C77055); Manufacturer: Murata; Dielectric Material: Ceramic; Voltage Rating: 50V; Capacitance: 100nF; Dielectric: X7R; Insulation Resistance: 10GR; Case Code (Metric): 1608; Lead Free: LeadFree; Depth: 0.8mm; Number of Pins: 2; Radiation Hardening: No; Case/Package: 0603; Manufacturer URL: http://www.murata.com/; Packaging: TapeandReel; Length: 1.6mm; Contact Plating: Tin; Datasheet URL: http://psearch.en.murata.com/capacitor/product/GRM188R71H104KA93%23.pdf; Tolerance: 10%; Case Code (Imperial): 0603; Min Operating Temperature: -55degC; RoHSCompliant: true; Voltage: 50V; Termination: SMD/SMT; Mount: SurfaceMount; Material: Ceramic; Package Quantity: 1; Height: 0.8mm; Thickness: 0.035inch; REACH SVHC: NoSVHC; Max Operating Temperature: 125degC; Width: 0.8mm; Package Reference: 0603; Voltage Rating (DC): 50V; Datasheet Version: 42675.0; Package Description: 2-Pin Surface Mount Device, Body 1.6 x 0.8 mm
C3 C6 = CMP-08246-001069-1: 10uF 50V X7R ±10% 1210 Multilayer Ceramic Capacitors MLCC - SMD/SMT ROHS ( / C53084452)
C5 = CMP-05428-000328-1: Molded Tantalum Polymer Capacitor 100uF 20% 10V life 2000Hours SMD 2917 (C147766); ESR (Equivalent Series Resistance): 45mR; Dissipation Factor: 10%; Leakage Current: 100uA; Ripple Current: 1.7A; Polarity: Polar; Height: 1.9mm; Case Code (Imperial): 2917; Depth: 4.3mm; Voltage Rating: 10V; Case/Package: 2917; Max Operating Temperature: 105°C; REACH SVHC: No SVHC; Voltage Rating (DC): 10V; Radiation Hardening: No; Capacitance: 100uF; Voltage: 10V; Termination: SMD/SMT; Number of Pins: 2; Features: General Purpose; Min Operating Temperature: -55°C; Series: POSCAP™ TPC; Tolerance: 20%; Packaging: Tape and Reel; Package Quantity: 3000; Height - Seated (Max): 0.079inch; RoHS Compliant: Yes; Case Code (Metric): 7343; Length: 7.3mm; Lead Free: Lead Free; Mount: Surface Mount; Construction: Flat; Width: 4.3mm
C8 C9 = CMP-03422-001167-1: 10uF 25V X5R ±10% 1206 Multilayer Ceramic Capacitors MLCC - SMD/SMT ROHS (C128855); Manufacturer: Yageo; Temperature Coefficient: 15%; Value: 1 uF; Tolerance: 0.1; Automotive Grade: NA; Temperature: -55°C to +125°C; Footprint Url: http://www.yageo.com/exep/pages/download/literatures/UPY-C_GEN_24.pdf; Lead Free: Yes; Device Class L2: Capacitors; Temperature Range High: +125°C; Manufacturer Part Number: CC1206KKX5R8BB105; Voltage Rating: 25 V; ComponentLink2Description: Datasheet; Device Class L3: Ceramic Capacitors; RoHS: TRUE; Temperature Characteristic: X5R; Digikey Description: CAP CER 1UF 25V X5R 1206; Mouser Description: Multilayer Ceramic Capacitors MLCC - SMD/SMT 1.0uF 25V X5R 10%; Capacitance: 1 uF; Material: Ceramic; Height: 1.45mm; Automotive: No; Category: Cap; Octopart: https://octopart.com/cc1206kkx5r8bb105-yageo-20779154; ComponentLink2URL: http://www.yageo.com/documents/recent/UPY-NP0X7R_HV_1KV-to-3KV_11.pdf; Package: CC1206-1.25; Device Class L1: Passive Components; Temperature Range Low: -55°C
CN11 CN12 = SSW-136-01-S-D: Connector; Manufacturer_Name: SAMTEC; Datasheet Link: http://suddendocs.samtec.com/prints/ssw-1xx-xx-xxx-x-xx-xxx-xx-mkt.pdf; Manufacturer_Part_Number: SSW-136-01-S-D
D1 = MBRA140T3G: -55℃~+125℃ 1A 30A 40V 500uA@40V 550mV@1A SMA(DO-214AC) Schottky Diodes ROHS (C54798); Manufacturer_Name: onsemi; Datasheet Link: https://www.onsemi.com/pub/Collateral/MBRA140T3-D.PDF; Height: 2.2mm; Manufacturer_Part_Number: MBRA140T3G; Mouser Part Number: 863-MBRA140T3G; Mouser Price/Stock: https://www.mouser.co.uk/ProductDetail/onsemi/MBRA140T3G?qs=3JMERSakebqN9fBNId59Xg%3D%3D; Arrow Part Number: MBRA140T3G; Arrow Price/Stock: https://www.arrow.com/en/products/mbra140t3g/on-semiconductor?utm_currency=USD&region=nac
D2 = CMP-1055-00390-1: -65℃~+150℃ 190A 300uA@40V 40V 500mV@5A 5A SMC(DO-214AB) Schottky Diodes ROHS (C31849); Manufacturer: On Semiconductor; Configuration: Single; Packing: Tape and Reel; IFSM Max (A): 190; ComponentLink1URL: http://www.onsemi.com/; ComponentLink3URL: http://www.onsemi.com/pub_link/Collateral/403-03.PDF; ComponentLink1Description: Manufacturer URL; PackageVersion: Rev. E, 08/2005; ComponentLink2URL: http://www.onsemi.cn/pub_link/Collateral/MBRS540T3-D.PDF; RoHS: TRUE; DatasheetVersion: Rev. 8; Mounting Technology: Surface Mount; ComponentLink3Description: Package Specification; ComponentLink2Description: Datasheet; PartNumber: MBRS540T3G; PackageDescription: 2-Pin Small Molded Package, J-Bend Lead, Body 5.845 x 6.855 mm; PackageReference: SMC-2-403-03
D3 = CMP-1667-00003-3: DIODE SCHOTTKY 40V 3A SMA ( / C15570); Max Forward Surge Current (Ifsm): 80A; Forward Voltage: 500mV; Polarity: Standard; Max Reverse Current: 500uA; Capacitance: 250pF; Element Configuration: Single; Mount: Surface Mount; Output Current: 3A; Radiation Hardening: No; Width: 2.92mm; Current Rating: 3A; Termination: SMD/SMT; Voltage: 40V; Series: -; Max Operating Temperature: 125°C; Current: 3A; Max Repetitive Reverse Voltage (Vrrm): 40V; Min Operating Temperature: -55°C; REACH SVHC: No SVHC; Number of Pins: 2; Average Rectified Current: 3A; Contact Plating: Tin; RoHS Compliant: Yes; Max Reverse Voltage (DC): 40V; Packaging: Tape and Reel; Height: 2.3mm; Length: 4.6mm; Case/Package: SMA; Weight: 0.002258oz; Peak Non-Repetitive Surge Current: 80A; Package Quantity: 5000; Lead Free: Lead Free; Forward Current: 3A; Voltage Rating (DC): 40V
DNP = Res_12K1_1%_0603: 0 (DNP); Manuf_Part_1: MCT 0603-50 1% P5 12K1; Manuf_1: VISHAY; Value: 12K1; Order: 2325243; ECCN_US/EU: n/a; Distrib: FARNELL
HDMI_IO = CMP-2000-05607-2: CONN RCPT HDMI 19POS SMD R/A; Gender: Female; Body Material: Metal; Voltage Rating (DC): 40V; Pitch: 0.5mm; Number of Positions: 19; Number of Ports: 1; Current Rating: 500mA; Shielding: Shielded; Halogen Free: Low Halogen; Radiation Hardening: No; Max Voltage Rating (DC): 40V; Contact Plating: Gold; Max Operating Temperature: 85°C; Number of Terminals/Pins: 19; Flammability Rating: UL94 V-0; Mount: Surface Mount; Weight: 0.072312oz; Lead Free: Lead Free; Depth: 12.15mm; Min Operating Temperature: -20°C; Packaging: Cut Tape; Package Quantity: 350; Number of Circuits: 19; Housing Material: Thermoplastic; Series: 47151; Color: Black; Contact Material: Copper Alloy; RoHS Compliant: Yes; Voltage Rating: 40V; Housing Color: Black; Case/Package: Metal; Length: 15mm; Orientation: Right Angle; Termination: SMD/SMT; Number of Contacts: 19
I1 = CMP-07248-000061-1: 2.3A 22uH 3.3A 96mΩ AEC-Q200 ±20% SMD,6x6mm Power Inductors ROHS (C2044314); DC Resistance (DCR): 96mR; RoHS Compliant: Yes; Packaging: Cut Tape; Inductance: 22uH; Saturation Current: 3.3A; RMS Current (Irms): 2.3A; Inductance Tolerance: 20%; REACH SVHC: No SVHC; Mount: Surface Mount
I2S_IN = CMP-1502-01332-4: THT Vertical Socket Header WR-PHD, Pitch 2.54 mm, Single Row, 10 pins; Contact Resistance: 20mΩ; Connector Type: Header, Socket; Gender: Female; Number of Positions: 10; Pitch: 2.54mm; Operating Supply Voltage: 250V; Insulation Resistance: 1GΩ; Current Rating: 3A; Insulation: Insulated; Color: Black; Mount: Through Hole; Length: 25.9mm; Lead Free: Lead Free; Number of Rows: 1; Contact Gender: Female; Max Operating Temperature: 125°C; Voltage Rating: 250V; Number of Contacts: 10; Width: 25.9mm; Flammability Rating: UL94 V-0; Orientation: Vertical; Housing Material: PBT; Lead Pitch: 2.54mm; Number of Pins: 10; RoHS: Compliant; Contact Material: Copper; Termination: Through Hole; Contact Plating: Gold; Height: 8.5mm; Min Operating Temperature: -40°C
IC1-IC3 = TBD62083AFWG,EL: Integrated Circuit (C108880); Manufacturer_Name: Toshiba; Datasheet Link: https://componentsearchengine.com//TBD62083AFWG,EL.pdf; Height: 2.85mm; Mouser2 Part Number: 757-TBD62083AFWGEL; Mouser2 Price/Stock: https://www.mouser.com/Search/Refine.aspx?Keyword=757-TBD62083AFWGEL; Manufacturer_Part_Number: TBD62083AFWG,EL
IO1-IO4 = 282834-2: Connector; Manufacturer_Name: TE Connectivity; Datasheet Link: https://componentsearchengine.com//282834-2.pdf; Mouser2 Part Number: 571-282834-2; Mouser2 Price/Stock: https://www.mouser.com/Search/Refine.aspx?Keyword=571-282834-2; Manufacturer_Part_Number: 282834-2
J1 J2 = CMP-1502-00188-1: DC Power Jack Connector WR-DC, Male, Right Angled, THT, 5 A, 24 V (C5441017); Manufacturer: Wurth Elektronik; Plug Inner Diameter: 2.05mm; Opening Diameter: 6.4mm; Rated Current: 5A; Plug Outer Diameter: 5.5mm; Working Voltage: 24V; Datasheet URL: http://katalog.we-online.de/em/datasheet/6941xx301002.pdf; Packaging: Bag; Manufacturer URL: http://www.we-online.de; Part Number: 694106301002; Gender: Male; Publisher: WurthElektronik; Operating Temperature: -40to85degC; Mounting Technology: THT; Package Reference: 694106301002; Orientation: RightAngled
M1A M1B M2A M2B M3A M3B M4A M4B M5A M5B M6A M6B M7A M7B M8A M8B = 5-535541-6: 1 1x8P 2.54mm 8P Square Hole Through Hole Top Plugin,P=2.54mm Female Headers ROHS (C27438); Manufacturer_Name: TE Connectivity; Datasheet Link: https://componentsearchengine.com/Datasheets/1/5-535541-6.pdf; Height: 6.73mm; Manufacturer_Part_Number: 5-535541-6
MCAP1_B MCAP2_B MCAP3_B MCAP4_B MCAP5_B MCAP6_B MCAP7_B MCAP8_B = CMP-08246-001069-1: 10uF 50V X7R ±10% 1210 Multilayer Ceramic Capacitors MLCC - SMD/SMT ROHS (C596319)
MOTOR1-MOTOR8 = CMP-1755-00007-1: Male Header, Pitch 2.5 mm, 1 x 4 Position, Height 6.1 mm, Tail Length 3.4 mm, -25 to 85 degC, RoHS, Bulk (C157925); PackageReference: S4B-XH-A(LF)(SN); ComponentLink1Description: Manufacturer URL; DatasheetVersion: May-16; ComponentLink2Description: Datasheet; ComponentLink2URL: http://www.jst-mfg.com/product/pdf/eng/eXH.pdf; ComponentLink1URL: http://www.jst.com/home2.html; PackageDescription: Male Header, Pitch 2.5 mm, 1 x 4 Position, Height 6.1 mm, Tail Length 3.4 mm
Photometry PORT-1-PORT-10 UART = CMP-1502-01725-1: Modular Jack WR-MJ, Plastic, Vertical Entry, THT, 8P8C (C86492); Manufacturer: Wurth Elektronik; Withstanding Voltage: 1000VAC; Contact Resistance: 20mOhm; Port: 1x1; Working Voltage: 120VAC; Rated Current: 1.5A; Compliance: Leadfree/RoHS; Entrance: Vertical; Publisher: WurthElektronik; Datasheet URL: https://katalog.we-online.de/em/datasheet/615008138021.pdf; Part Number: 615008138021; Manufacturer URL: http://www.we-online.de; Pin Number: 8P8C; Mounting Technology: THT; Operating Temperature: -40to85degC; Package Reference: 615008138021; Packaging: Tray
R1 = Res_12K1_1%_0603: -55℃~+155℃ 100mW 680kΩ 75V Thick Film Resistor ±1% ±100ppm/℃ 0603 Chip Resistor - Surface Mount ROHS (C137690); Manuf_Part_1: MCT 0603-50 1% P5 12K1; Manuf_1: VISHAY; Value: 12K1; Order: 2325243; ECCN_US/EU: n/a; Distrib: FARNELL
R2 = Res_12K1_1%_0603: -55℃~+155℃ 100kΩ 100mW 75V Thick Film Resistor ±1% ±100ppm/℃ 0603 Chip Resistor - Surface Mount ROHS (C14675); Manuf_Part_1: MCT 0603-50 1% P5 12K1; Manuf_1: VISHAY; Value: 12K1; Order: 2325243; ECCN_US/EU: n/a; Distrib: FARNELL
R3 = Res_12K1_1%_0603: -55℃~+155℃ 100mW 10kΩ 75V Thick Film Resistor ±1% ±100ppm/℃ 0603 Chip Resistor - Surface Mount ROHS (C99198); Manuf_Part_1: MCT 0603-50 1% P5 12K1; Manuf_1: VISHAY; Value: 12K1; Order: 2325243; ECCN_US/EU: n/a; Distrib: FARNELL
R4 = Res_12K1_1%_0603: -55℃~+155℃ 100mW 3.24kΩ 75V Thick Film Resistor ±1% ±100ppm/℃ 0603 Chip Resistor - Surface Mount ROHS (C227860); Manuf_Part_1: MCT 0603-50 1% P5 12K1; Manuf_1: VISHAY; Value: 12K1; Order: 2325243; ECCN_US/EU: n/a; Distrib: FARNELL
R12-R35 = Res_12K1_1%_0603: -55℃~+155℃ 100mW 10kΩ 75V Thick Film Resistor ±100ppm/℃ ±5% 0603 Chip Resistor - Surface Mount ROHS (C99198); Manuf_Part_1: MCT 0603-50 1% P5 12K1; Manuf_1: VISHAY; Value: 12K1; Order: 2325243; ECCN_US/EU: n/a; Distrib: FARNELL
SPI_BUS? = CMP-17439-000051-1: -25℃~+85℃ 1 100V 15.95mm 1x6P 2A 2mm 6 6.6mm 6P 7mm Auxiliary Solder Pin Beige Copper Alloy PA PH Surface Mount,Vertical Tin UL94V-0 SMD,P=2mm Wire To Board Connector ROHS (C471518); Number of Positions: 6; Contact Resistance: 10mR; Insulation Resistance: 1GR; Connector Type: Header; Mated Stacking Heights: 8.6mm; Gender: Male; Max Operating Temperature: 85°C; Contact Finish - Mating: TIN; Min Operating Temperature: -25°C; Height: 9.4mm; Contact Plating: Tin; Number of Poles: 6; Series: PH; Number of Rows: 1; Termination: Solder; Packaging: Tape and Reel; Contact Mating Length: 0.13inch; Working Voltage: 100V; Voltage Rating (AC): 100V; Insulation Height: 0.26inch; Mount: Surface Mount; Contact Material: Copper Alloy; Length: 13.9mm; Contact Shape: Square; Flammability Rating: UL94 V-0; Current Rating: 2A; Voltage Rating: 100V; Contact Type: Male Pin; Lead Pitch: 2mm; Housing Color: Natural; Color: Natural; Insulation Material: Nylon; Insulation Color: Natural; REACH SVHC: No SVHC; Housing Material: Nylon; Pitch: 2mm; Fastening Type: Detent; Orientation: Straight; Lead Free: Lead Free; Width: 5.5mm; Number of Contacts: 6
T1-T10 = CMP-17439-000014-3: -25℃~+85℃ 1 1x3P 2.5mm 3 3A 3P Brass Through Hole Tin XH Plugin,P=2.5mm Wire To Board Connector ROHS (C2908601); Max Voltage Rating (DC): 250V; Number of Positions: 3; Color: Natural; Connector Type: Header; Gender: Male; Wire/Cable Gauge: 22AWG; Contact Resistance: 20mR; Insulation Resistance: 1GR; Insulation Material: Nylon; Contact Plating: Tin; Depth: 5.75mm; Contact Type: Male Pin; Max Operating Temperature: 85°C; Current Rating: 3A; Insulation Color: Natural; Voltage Rating (AC): 250V; Orientation: Straight; Fastening Type: Detent; Housing Color: White; Min Operating Temperature: -25°C; Termination: Solder; Voltage Rating: 250V; Series: XH; Pitch: 2.5mm; Contact Shape: Square; Number of Rows: 1; Lead Free: Lead Free; Packaging: Bulk; Mount: Through Hole; Flammability Rating: UL94 V-0; Max Voltage Rating (AC): 250V; REACH SVHC: No SVHC; Housing Material: Polyamide; Contact Material: Brass; Lead Pitch: 2.5mm; Contact Finish - Mating: TIN; Length: 9.9mm; Max Current Rating: 3A; Number of Contacts: 3
TSR_12V = CMP-49942-000013-2: DC DC CONVERTER 5V 10W; NexarPartId: 71799544; Min Supply Voltage: 6.5V; Max Supply Voltage: 36V; Number of Outputs: 1; Switching Frequency: 1.2MHz; Output Current: 2A; Output Voltage: 5V; Mount: Through Hole; Min Operating Temperature: -40°C; RoHS: Non-Compliant; Max Operating Temperature: 85°C; Width: 7.5mm; Output Power: 10W; Height: 10.1mm; Case/Package: SIP
U1_5V_ = CMP-0323-00172-3: Buck Step Down Regulator with 5.5 to 36 V Input and 1.23 to 31 V Output, -40 to 125 degC, 8-Pin SOIC (D), Green (C10111); Manufacturer: Texas Instruments; Iq(Typ)(mA): 3; Vout(Min)(V): 1.23; SubFamily: Step-Down Regulator; Eco-Plan: Green (RoHS & no Sb/Br); Regulated Outputs(#): 1; Rating: Catalog; Vout(Max)(V): 31; Iout(Max)(A): 2; Vin(Max)(V): 36; Duty Cycle(Max)(%): 87; Vin(Min)(V): 5.5; DatasheetVersion: SLVS642C; PackageDescription: 8-Pin Plastic Small Outline Integrated Circuit, 4.9 x 3.9 mm, Pitch 1.27 mm Pitch; ComponentLink1URL: http://www.ti.com/general/docs/lit/getliterature.tsp?genericPartNumber=TPS5420&fileType=pdf; ComponentLink3Description: URL Link1; ComponentLink1Description: Datasheet; ComponentLink2URL: http://www.ti.com/litv/pdf/msoi002j; Topology: Buck; Switch Current Limit(Typ)(A): 3; Code_JEDEC: MS-012AA; PartNumber: TPS5420DR; PackageVersion: revM, Jun-2011; Mounting Technology: Surface Mount; PackageReference: D0008A; ComponentLink2Description: Package Specification; ComponentLink3URL: Samples URL:http://www.ti.com/product/tps5420#samples
U_3V3 = CMP-1679-00010-1: Low-Dropout Positive Fixed Voltage Regulator, 1 A, 3.3 V Output Voltage, 0 to 125 degC, 4-Pin SOT-223 (318H-01), Pb-Free, Tape and Reel (C26537); Resistance: 220 kohm; Type (Resistor): Thick Film; Voltage Rating: 75 V; Tolerance: 1%; Case\Package: 0603; Power Rating: 100 mW; Width: 0.85 mm; Weight: 7.1E-05 oz; ComponentLink2URL: http://www.onsemi.com/pub_link/Collateral/NCP1117-D.PDF; RoHSCompliant: true; Height: 0.45 mm; PackageDescription: 4-Pin Small Outline Transistor, Body 6.5 x 3.5 mm, Pitch 2.3 mm; ComponentLink1Description: Manufacturer URL; ComponentLink1URL: http://www.onsemi.com/; PackageReference: SOT-223-4-318H-01_A; Max Operating Temperature: 155 degC; Packaging: Tape and Reel; REACH SVHC: Unknown; Length: 1.55 mm; Package Quantity: 5000; Radiation Hardening: No; Min Operating Temperature: -55 degC; DatasheetVersion: Rev. 27, 09/2014; Mount: Surface Mount; Case Code (Imperial): 0603; Case Code (Metric): 1608; ComponentLink2Description: Datasheet